# Altium schematic sheet push-button-switch-8.SchDoc
size A4; SheetNumber: 8; SheetTotal: 17
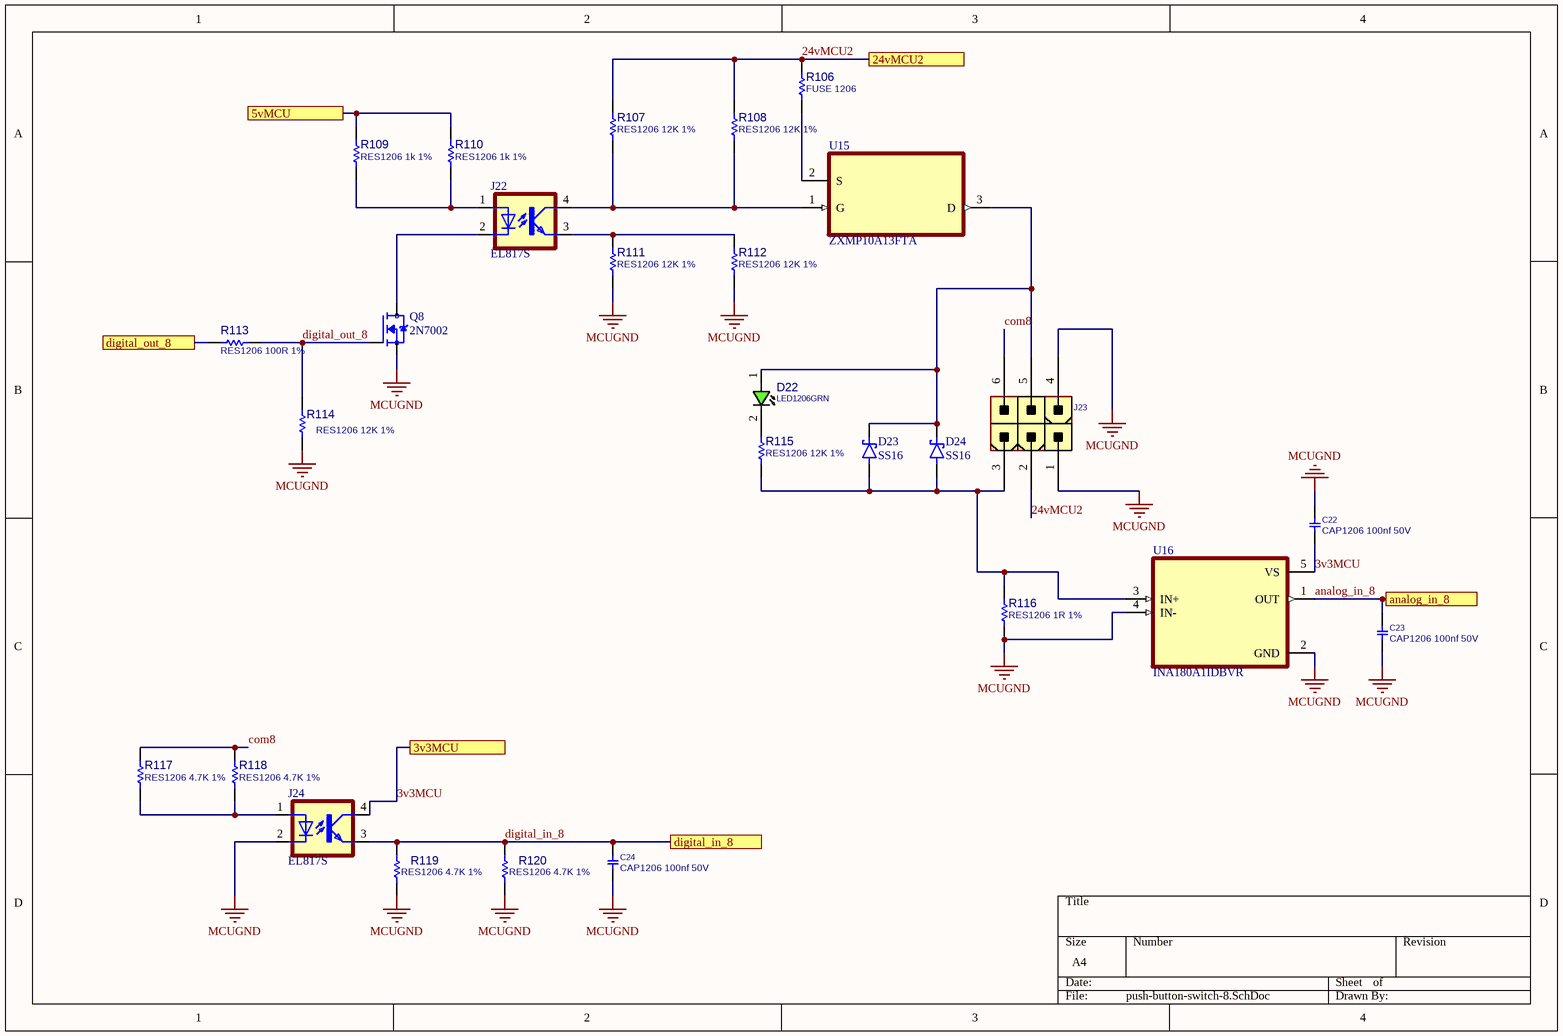
[diagram p0: push-button-switch-8.SchDoc]

## Parts
C22  CAP1206 100nf 50V  [C1206]
C23  CAP1206 100nf 50V  [C1206]
C24  CAP1206 100nf 50V  [C1206]
D22  LED1206GRN  [LED1206GRN]
D23  SS16  [DIOM4325X250N]
D24  SS16  [DIOM4325X250N]
J22  EL817S  [SOIC254P1030X460-4N]
J23  CONN_ATXPWR_6  [ATXPWR_6]  (value not drawn)
J24  EL817S  [SOIC254P1030X460-4N]
Q8  2N7002  [SOT95P240X111-3N]
R106  FUSE 1206  [R1206]
R107  RES1206 12K 1%  [R1206]
R108  RES1206 12K 1%  [R1206]
R109  RES1206 1k 1%  [R1206]
R110  RES1206 1k 1%  [R1206]
R111  RES1206 12K 1%  [R1206]
R112  RES1206 12K 1%  [R1206]
R113  RES1206 100R 1%  [R1206]
R114  RES1206 12K 1%  [R1206]
R115  RES1206 12K 1%  [R1206]
R116  RES1206 1R 1%  [R1206]
R117  RES1206 4.7K 1%  [R1206]
R118  RES1206 4.7K 1%  [R1206]
R119  RES1206 4.7K 1%  [R1206]
R120  RES1206 4.7K 1%  [R1206]
U15  ZXMP10A13FTA  [SOT95P230X110-3N]
U16  INA180A1IDBVR  [SOT95P280X145-5N]

## Ports
3v3MCU, 5vMCU, 24vMCU2, analog_in_8, digital_in_8, digital_out_8

## Nets
MCUGND: C22.1 C23.2 C24.2 J23.1 J23.4 J24.2(C) Q8.2(S) R111.2 R112.2 R114.2 R116.2 R119.1 R120.1 U16.2(GND) U16.4(IN-)
3v3MCU: C22.2 J24.4(COL) U16.5(VS) ; port 3v3MCU
5vMCU: R109.2 R110.2 ; port 5vMCU
24vMCU2: J23.2 R106.1 R107.1 R108.1 ; port 24vMCU2
analog_in_8: C23.1 U16.1(OUT) ; port analog_in_8
com8: J23.6 R117.2 R118.2
digital_in_8: C24.1 J24.3(EMIT) R119.2 R120.2 ; port digital_in_8
digital_out_8: Q8.1(G) R113.2 R114.1
digital_out_8: R113.1 ; port digital_out_8  [a separate net that carries the same name]
NetD22_1: D22.1(ANODE) D23.C(K) D24.C(K) J23.5 U15.3(D)
NetD22_2: D22.2(CATHODE) R115.1
NetD23_A: D23.A D24.A J23.3 R115.2 R116.1 U16.3(IN+)
NetJ22_1: J22.1(A) R109.1 R110.1
NetJ22_2: J22.2(C) Q8.3(D)
NetJ22_3: J22.3(EMIT) R111.1 R112.1
NetJ22_4: J22.4(COL) R107.2 R108.2 U15.1(G)
NetJ24_1: J24.1(A) R117.1 R118.1
NetR106_2: R106.2 U15.2(S)

## Library data of the parts
C22-C24 = CAP_SMD_MLCC_1206: CAP, MLCC; PARAM: -, -%; MANF_P#: MANF_PART#; PARAM2: -V; PRICE: 100= 1$; MANF: -; ASSEMBLY: ASSEMBLY
D22 = LED_SMD_1206_GRN: LED, SMD, 1206, GREEN; PARAM: 20mA; DESC: DESCRIPTION; PARAM2: 2.2V; MANF: -; ASSEMBLY: ASSEMBLY; PRICE: 36t@Javan; MANF_P#: -; VALUE: LED1206GRN; MountType: SMT; PartType: LED
D23 D24 = SS14: 1A, 40V, Schottky Rectifier; MF: Taiwan Semiconductor; SnapEDA_Link: https://www.snapeda.com/parts/SS14/taiwan/view-part/?ref=snap; Package: SMA-2 Taiwan Semiconductor; Value: *; MP: SS14; Check_prices: https://www.snapeda.com/parts/SS14/taiwan/view-part/?ref=eda
J22 J24 = EL817S: Optoisolator Transistor Output 5000Vrms 1 Channel 4-SMD; MF: Everlight Electronics; SnapEDA_Link: https://www.snapeda.com/parts/EL817S/Everlight+Electronics+Co+Ltd/view-part/?ref=snap; Package: SMD-4 Everlight Electronics Co Ltd; Value: *; MP: EL817S; Check_prices: https://www.snapeda.com/parts/EL817S/Everlight+Electronics+Co+Ltd/view-part/?ref=eda
J23 = CONN_ATXPWR_6: CONN, ATX POWER, 6 P; MANF: TE; MANF_P#: 4-1775099-1; VALUE: CONN_ATXPWR_6; MountType: THD; PACKAGE: ATXPWR-6pin; Part Type: Conn.
Q8 = 2N7002: N-Channel 60V 280mA (Ta) 350mW (Ta) Surface Mount SOT-23-3 (TO-236); MF: {'manufacturer': u'onsemi'}; Package: None; Price: None; Value: *; MP: 2N7002; Availability: Unavailable
R106-R120 = RES_SMD_1206: RESISTOR, SMD; PARAM: 1%, 0.25W; DESC: DESCRIPTION; DIST#: MOUSER; MANF_P#: -; MANF: -; ASSEMBLY: ASSEMBLY; PRICE: -; PARAM2: -
U15 = ZXMP10A13FTA: P-Channel 100 V 600mA (Ta) 625mW (Ta) Surface Mount SOT-23-3; MF: Diodes Inc.; Purchase-URL: https://pricing.snapeda.com/search/part/ZXMP10A13FTA/?ref=eda; Package: SOT-23-3 Diodes Inc.; SnapEDA_Link: https://www.snapeda.com/parts/ZXMP10A13FTA/Diodes+Inc./view-part/?ref=snap; Availability: In Stock; Value: *; MP: ZXMP10A13FTA; Check_prices: https://www.snapeda.com/parts/ZXMP10A13FTA/Diodes+Inc./view-part/?ref=eda; Price: None
U16 = INA180A1IDBVR: 26V, 350kHz current sense amplifier; MF: Texas Instruments; SnapEDA_Link: https://www.snapeda.com/parts/INA180A1IDBVR/Texas+Instruments/view-part/?ref=snap; Package: SOT-23-5 Texas Instruments; Value: *; MP: INA180A1IDBVR; Check_prices: https://www.snapeda.com/parts/INA180A1IDBVR/Texas+Instruments/view-part/?ref=eda